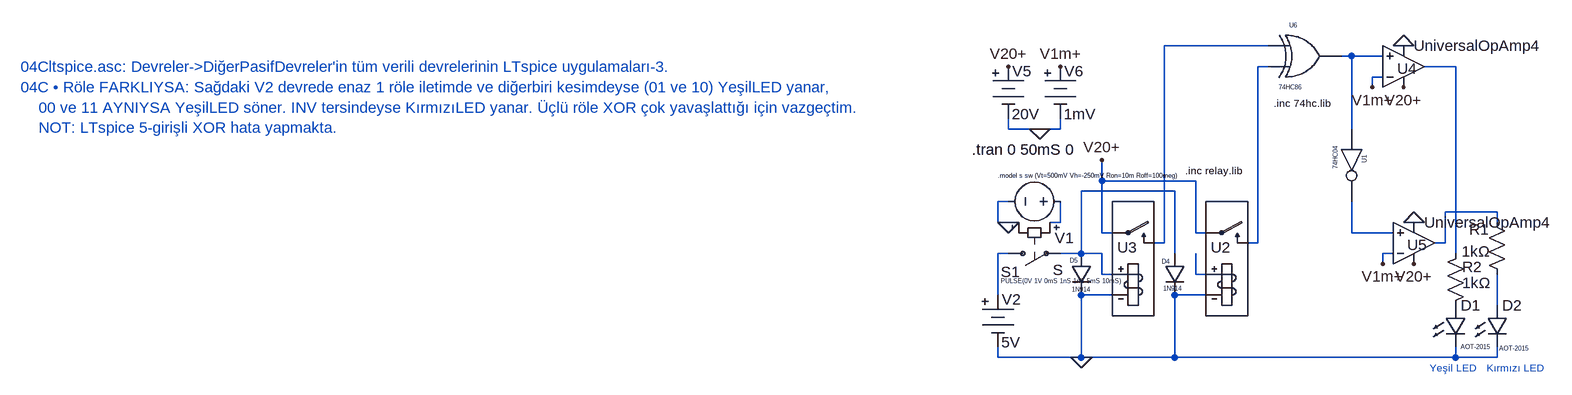
[diagram p0: schematic 04Cltspice.asc]
04Cltspice.asc, the LTspice schematic file:
Version 4
SHEET 1 3332 2492
WIRE 1136 16 976 16
WIRE 1264 32 1248 32
WIRE 1312 32 1264 32
WIRE 1136 48 1120 48
WIRE 1424 48 1376 48
WIRE 1312 64 1296 64
WIRE 1296 80 1296 64
WIRE 736 144 736 128
WIRE 784 144 736 144
WIRE 816 144 816 128
WIRE 816 144 784 144
WIRE 1264 144 1264 32
WIRE 880 224 880 192
WIRE 1024 224 880 224
WIRE 992 240 848 240
WIRE 736 256 720 256
WIRE 1488 272 1408 272
WIRE 720 288 720 256
WIRE 736 288 720 288
WIRE 752 288 736 288
WIRE 816 288 816 256
WIRE 816 288 800 288
WIRE 1488 288 1488 272
WIRE 880 304 880 224
WIRE 896 304 880 304
WIRE 1024 304 1024 224
WIRE 1040 304 1024 304
WIRE 1264 304 1264 256
WIRE 1328 304 1264 304
WIRE 976 320 976 16
WIRE 976 320 960 320
WIRE 1120 320 1120 48
WIRE 1120 320 1104 320
WIRE 1408 320 1408 272
WIRE 1408 320 1392 320
WIRE 736 336 720 336
WIRE 848 336 848 240
WIRE 848 336 816 336
WIRE 880 336 848 336
WIRE 992 336 992 240
WIRE 1328 336 1312 336
WIRE 1424 336 1424 48
WIRE 1312 352 1312 336
WIRE 880 368 880 336
WIRE 896 368 880 368
WIRE 1024 368 1024 336
WIRE 1040 368 1024 368
WIRE 720 400 720 336
WIRE 896 400 848 400
WIRE 1040 400 992 400
WIRE 1488 416 1488 368
WIRE 720 496 720 480
WIRE 848 496 848 400
WIRE 848 496 720 496
WIRE 992 496 992 400
WIRE 992 496 848 496
WIRE 1424 496 1424 480
WIRE 1424 496 992 496
WIRE 1488 496 1488 480
WIRE 1488 496 1424 496
FLAG 736 288 0
FLAG 848 496 0
FLAG 1344 80 V20+
FLAG 1344 16 0
FLAG 1360 352 V20+
FLAG 1360 288 0
FLAG 736 48 V20+
FLAG 784 144 0
FLAG 816 48 V1m+
FLAG 1296 80 V1m+
FLAG 1312 352 V1m+
FLAG 880 192 V20+
SYMBOL sw 720 336 M90
WINDOW 0 28 34 VLeft 2
WINDOW 3 25 100 VLeft 2
SYMATTR InstName S1
SYMATTR Value S
SYMBOL voltage 832 256 M270
WINDOW 0 -56 -5 VRight 2
WINDOW 3 -122 -76 VRight 0
WINDOW 123 0 0 Left 0
WINDOW 39 0 0 Left 0
SYMATTR InstName V1
SYMATTR Value PULSE(0V 1V 0mS 1nS 1nS 5mS 10mS)
SYMBOL res 1504 384 R180
WINDOW 0 28 85 Left 2
WINDOW 3 26 51 Left 2
SYMATTR InstName R1
SYMATTR Value 1kΩ
SYMBOL Misc\\battery 720 384 R0
WINDOW 0 6 23 Left 2
WINDOW 3 5 89 Left 2
SYMATTR InstName V2
SYMATTR Value 5V
SYMBOL LED 1408 416 R0
WINDOW 3 24 64 Left 0
SYMATTR Value AOT-2015
SYMATTR InstName D1
SYMATTR Description Diode
SYMATTR Type diode
SYMBOL LED 1472 416 R0
WINDOW 3 19 66 Left 0
SYMATTR Value AOT-2015
SYMATTR InstName D2
SYMATTR Description Diode
SYMATTR Type diode
SYMBOL res 1408 432 M180
WINDOW 0 26 75 Left 2
WINDOW 3 26 51 Left 2
SYMATTR InstName R2
SYMATTR Value 1kΩ
SYMBOL OpAmps\\UniversalOpAmp4 1344 48 M180
WINDOW 0 -10 -3 Left 2
SYMATTR InstName U4
SYMBOL OpAmps\\UniversalOpAmp4 1360 320 M180
WINDOW 0 -10 -3 Left 2
SYMATTR InstName U5
SYMBOL Misc\\battery 736 32 R0
WINDOW 0 6 23 Left 2
WINDOW 3 5 89 Left 2
SYMATTR InstName V5
SYMATTR Value 20V
SYMBOL Misc\\battery 816 32 R0
WINDOW 0 6 23 Left 2
WINDOW 3 5 89 Left 2
SYMATTR InstName V6
SYMATTR Value 1mV
SYMBOL rly_spst-no 1072 320 R0
WINDOW 0 -9 7 Center 2
SYMATTR InstName U2
SYMBOL diode 1008 336 M0
WINDOW 0 23 12 Left 0
WINDOW 3 4 54 Left 0
SYMATTR InstName D4
SYMATTR Value 1N914
SYMBOL rly_spst-no 928 320 R0
WINDOW 0 -9 7 Center 2
SYMATTR InstName U3
SYMBOL diode 864 336 M0
WINDOW 0 21 11 Left 0
WINDOW 3 1 55 Left 0
SYMATTR InstName D5
SYMATTR Value 1N914
SYMBOL 74hc86 1184 -32 R0
SYMATTR InstName U6
SYMBOL 74hc04 1328 192 R90
WINDOW 0 -8 44 Left 0
WINDOW 3 -22 89 Left 0
SYMATTR InstName U1
TEXT -784 48 Left 2 ;04Cltspice.asc: Devreler->DiğerPasifDevreler'in tüm verili devrelerinin LTspice uygulamaları-3.
TEXT -784 80 Left 2 ;04C • Röle FARKLIYSA: Sağdaki V2 devrede enaz 1 röle iletimde ve diğerbiri kesimdeyse (01 ve 10) YeşilLED yanar,\n    00 ve 11 AYNIYSA YeşilLED söner. INV tersindeyse KırmızıLED yanar. Üçlü röle XOR çok yavaşlattığı için vazgeçtim.\n    NOT: LTspice 5-girişli XOR hata yapmakta.
TEXT 1472 512 Left 1 ;Kırmızı LED
TEXT 1384 512 Left 1 ;Yeşil LED
TEXT 1008 208 Left 1 !.inc relay.lib
TEXT 720 216 Left 0 !.model s sw (Vt=500mV Vh=-250mV Ron=10m Roff=100meg)
TEXT 680 176 Left 2 !.tran 0 50mS 0
TEXT 1144 104 Left 1 !.inc 74hc.lib

The netlist it stands for:
* 04Cltspice.asc
S1 N009 N005 N007 0 S
V1 N007 0 PULSE(0V 1V 0mS 1nS 1nS 5mS 10mS)
R1 N011 N006 1kΩ
V2 N009 0 5V
D1 P001 0 AOT-2015
D2 N011 0 AOT-2015
R2 P001 N004 1kΩ
* U4: UniversalOpAmp4 (symbol OpAmps\UniversalOpAmp4 not available, pins judged from their places): In+=N002 In-=V1m+ V+=V20+ V-=0 OUT=N004
* U5: UniversalOpAmp4 (symbol OpAmps\UniversalOpAmp4 not available, pins judged from their places): In+=N008 In-=V1m+ V+=V20+ V-=0 OUT=N006
V5 V20+ 0 20V
V6 V1m+ 0 1mV
XU2 N010 0 V20+ N003 RLY_SIG1NO VNOM=5 RCOIL=500 VON=0.8 VOFF=0.4 RON=0.1 ROFF=1G COFF=1f LSER=1f CCOUP=1f TON=1m TOFF=1m LCOIL=10m CCOIL=1f  ; pins L+ L- SIN SON
D4 N005 0 1N914
XU3 N005 0 V20+ N001 RLY_SIG1NO VNOM=5 RCOIL=500 VON=0.8 VOFF=0.4 RON=0.1 ROFF=1G COFF=1f LSER=1f CCOUP=1f TON=1m TOFF=1m LCOIL=10m CCOIL=1f  ; pins L+ L- SIN SON
D5 N005 0 1N914
XU6 N001 N003 N002 VCC 0 74HC86 VCC=5  SPEED=1.0  TRIPDT=1e-9  ; pins A B Y
XU1 N002 N008 VCC 0 74HC04 VCC=5  SPEED=1.0  TRIPDT=1e-9  ; pins A Y
.model D D
.lib standard.dio
* 04Cltspice.asc: Devreler->DiğerPasifDevreler'in tüm verili devrelerinin LTspice uygulamaları-3.
* 04C • Röle FARKLIYSA: Sağdaki V2 devrede enaz 1 röle iletimde ve diğerbiri kesimdeyse (01 ve 10) YeşilLED yanar,
*     00 ve 11 AYNIYSA YeşilLED söner. INV tersindeyse KırmızıLED yanar. Üçlü röle XOR çok yavaşlattığı için vazgeçtim.
*     NOT: LTspice 5-girişli XOR hata yapmakta.
* Kırmızı LED
* Yeşil LED
.inc relay.lib
.model s sw (Vt=500mV Vh=-250mV Ron=10m Roff=100meg)
.tran 0 50mS 0
.inc 74hc.lib
.lib relay.lib
.backanno
.end